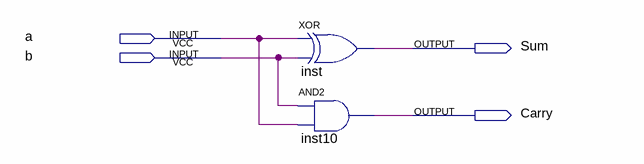
[diagram p0: schematic sheet]
// Quartus schematic Half_adder.bdf as structural Verilog: 2 symbols, 4 pins
module Half_adder (
  input  a,
  input  b,
  output Sum,
  output Carry
);

  xor inst (Sum, a, b);
  and inst10 (Carry, b, a);
endmodule
